# Altium schematic sheet Top_Sheet.SchDoc
size A4; SheetNumber: 1; SheetTotal: 12
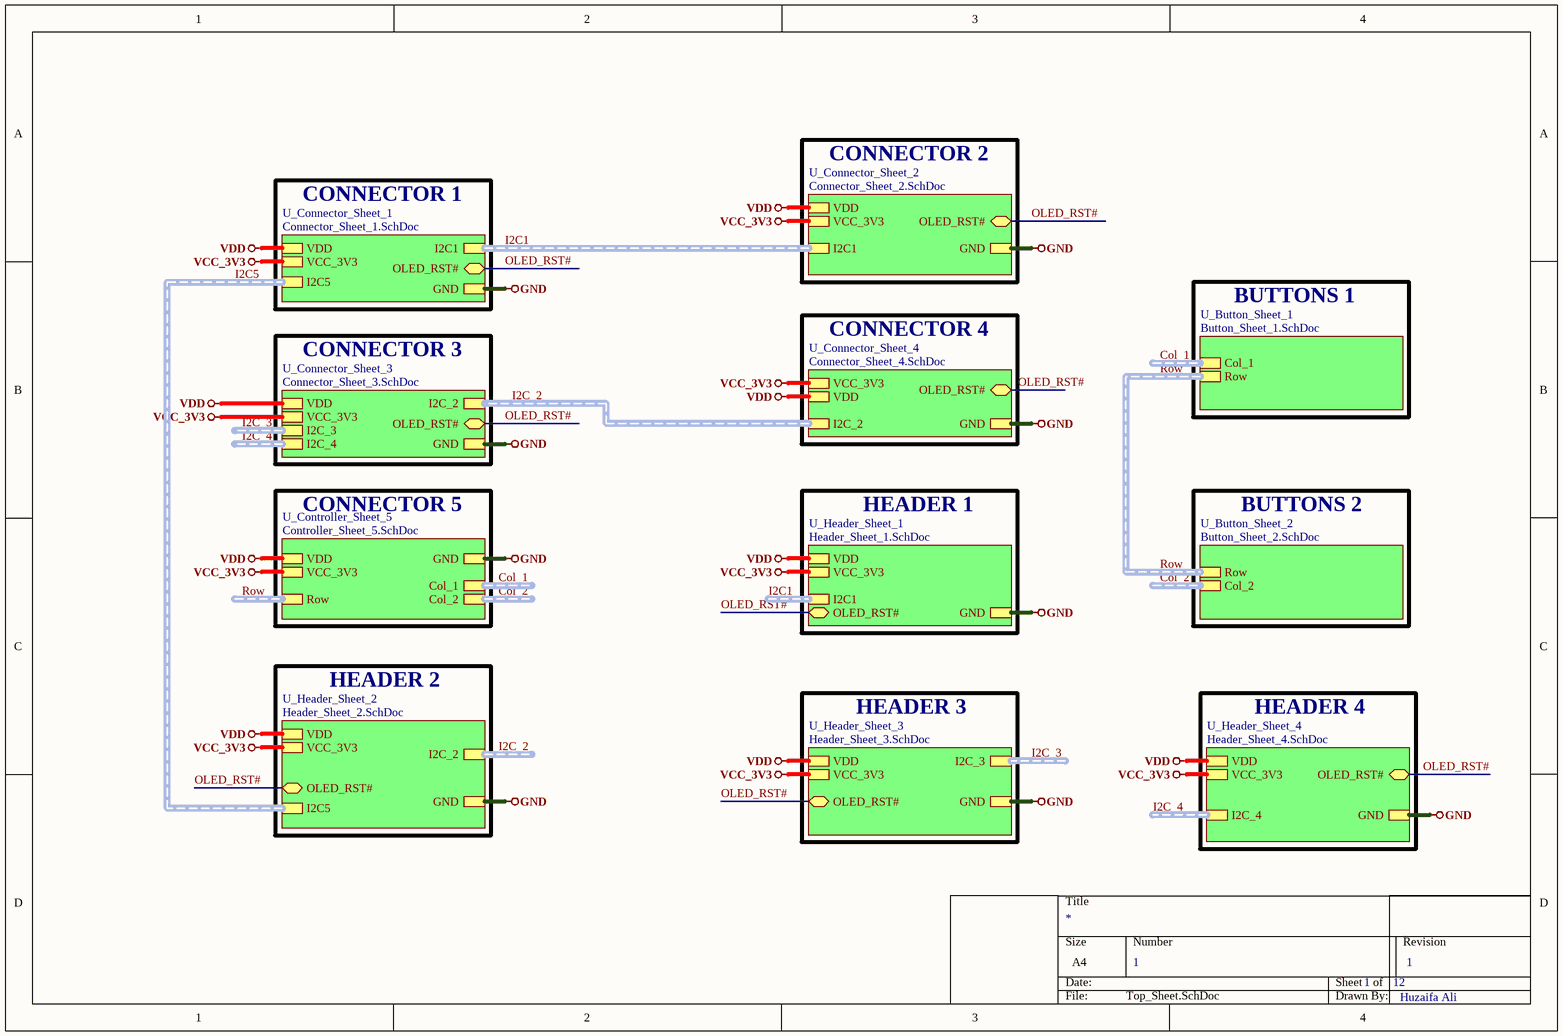
[diagram p0: Top_Sheet.SchDoc]

## Sub-sheets
U_Button_Sheet_1 = Button_Sheet_1.SchDoc: Col_1 (harness Col_1), Row (harness Row)
U_Button_Sheet_2 = Button_Sheet_2.SchDoc: Col_2 (harness Col_2), Row (harness Row)
U_Connector_Sheet_1 = Connector_Sheet_1.SchDoc: I2C1 (harness I2C1), VDD, VCC_3V3, GND, OLED_RST# (bidir), I2C5 (harness I2C5)
U_Connector_Sheet_2 = Connector_Sheet_2.SchDoc: I2C1 (harness I2C1), VDD, VCC_3V3, GND, OLED_RST# (bidir)
U_Connector_Sheet_3 = Connector_Sheet_3.SchDoc: VDD, VCC_3V3, GND, I2C_2 (harness I2C_2), OLED_RST# (bidir), I2C_3 (harness I2C_3), I2C_4 (harness I2C_4)
U_Connector_Sheet_4 = Connector_Sheet_4.SchDoc: I2C_2 (harness I2C_2), VDD, VCC_3V3, GND, OLED_RST# (bidir)
U_Controller_Sheet_5 = Controller_Sheet_5.SchDoc: VDD, VCC_3V3, GND, Col_1 (harness Col_1), Row (harness Row), Col_2 (harness Col_2)
U_Header_Sheet_1 = Header_Sheet_1.SchDoc: VDD, VCC_3V3, GND, I2C1 (harness I2C1), OLED_RST# (bidir)
U_Header_Sheet_2 = Header_Sheet_2.SchDoc: VDD, VCC_3V3, GND, OLED_RST# (bidir), I2C_2 (harness I2C_2), I2C5 (harness I2C5)
U_Header_Sheet_3 = Header_Sheet_3.SchDoc: I2C_3 (harness I2C_3), VDD, VCC_3V3, GND, OLED_RST# (bidir)
U_Header_Sheet_4 = Header_Sheet_4.SchDoc: OLED_RST# (bidir), I2C_4 (harness I2C_4), VDD, VCC_3V3, GND

## Nets
GND: sheet U_Connector_Sheet_1/GND, sheet U_Connector_Sheet_2/GND, sheet U_Connector_Sheet_3/GND, sheet U_Connector_Sheet_4/GND, sheet U_Controller_Sheet_5/GND, sheet U_Header_Sheet_1/GND, sheet U_Header_Sheet_2/GND, sheet U_Header_Sheet_3/GND, sheet U_Header_Sheet_4/GND
VCC_3V3: sheet U_Connector_Sheet_1/VCC_3V3, sheet U_Connector_Sheet_2/VCC_3V3, sheet U_Connector_Sheet_3/VCC_3V3, sheet U_Connector_Sheet_4/VCC_3V3, sheet U_Controller_Sheet_5/VCC_3V3, sheet U_Header_Sheet_1/VCC_3V3, sheet U_Header_Sheet_2/VCC_3V3, sheet U_Header_Sheet_3/VCC_3V3, sheet U_Header_Sheet_4/VCC_3V3
VDD: sheet U_Connector_Sheet_1/VDD, sheet U_Connector_Sheet_2/VDD, sheet U_Connector_Sheet_3/VDD, sheet U_Connector_Sheet_4/VDD, sheet U_Controller_Sheet_5/VDD, sheet U_Header_Sheet_1/VDD, sheet U_Header_Sheet_2/VDD, sheet U_Header_Sheet_3/VDD, sheet U_Header_Sheet_4/VDD
OLED_RST#: sheet U_Connector_Sheet_1/OLED_RST#, sheet U_Connector_Sheet_2/OLED_RST#, sheet U_Connector_Sheet_3/OLED_RST#, sheet U_Connector_Sheet_4/OLED_RST#, sheet U_Header_Sheet_1/OLED_RST#, sheet U_Header_Sheet_2/OLED_RST#, sheet U_Header_Sheet_3/OLED_RST#, sheet U_Header_Sheet_4/OLED_RST#

## Buses and harness runs
harness Col_1 = sheet U_Button_Sheet_1/Col_1
harness Col_1 = sheet U_Controller_Sheet_5/Col_1
harness Col_2 = sheet U_Button_Sheet_2/Col_2
harness Col_2 = sheet U_Controller_Sheet_5/Col_2
harness I2C1 = sheet U_Connector_Sheet_1/I2C1 = sheet U_Connector_Sheet_2/I2C1
harness I2C1 = sheet U_Header_Sheet_1/I2C1
harness I2C5 = sheet U_Connector_Sheet_1/I2C5 = sheet U_Header_Sheet_2/I2C5
harness I2C_2 = sheet U_Connector_Sheet_3/I2C_2 = sheet U_Connector_Sheet_4/I2C_2
harness I2C_2 = sheet U_Header_Sheet_2/I2C_2
harness I2C_3 = sheet U_Connector_Sheet_3/I2C_3
harness I2C_3 = sheet U_Header_Sheet_3/I2C_3
harness I2C_4 = sheet U_Connector_Sheet_3/I2C_4
harness I2C_4 = sheet U_Header_Sheet_4/I2C_4
harness Row = sheet U_Button_Sheet_1/Row = sheet U_Button_Sheet_2/Row
harness Row = sheet U_Controller_Sheet_5/Row

## Notes on the sheet
- CONNECTOR 2
- CONNECTOR 1
- BUTTONS 1
- CONNECTOR 3
- CONNECTOR 4
- CONNECTOR 5
- HEADER 1
- BUTTONS 2
- HEADER 2
- HEADER 3
- HEADER 4
- 1
- Huzaifa Ali